# EAGLE design Electret Mic Preamp v1.1 (EAGLE 7.6.0)
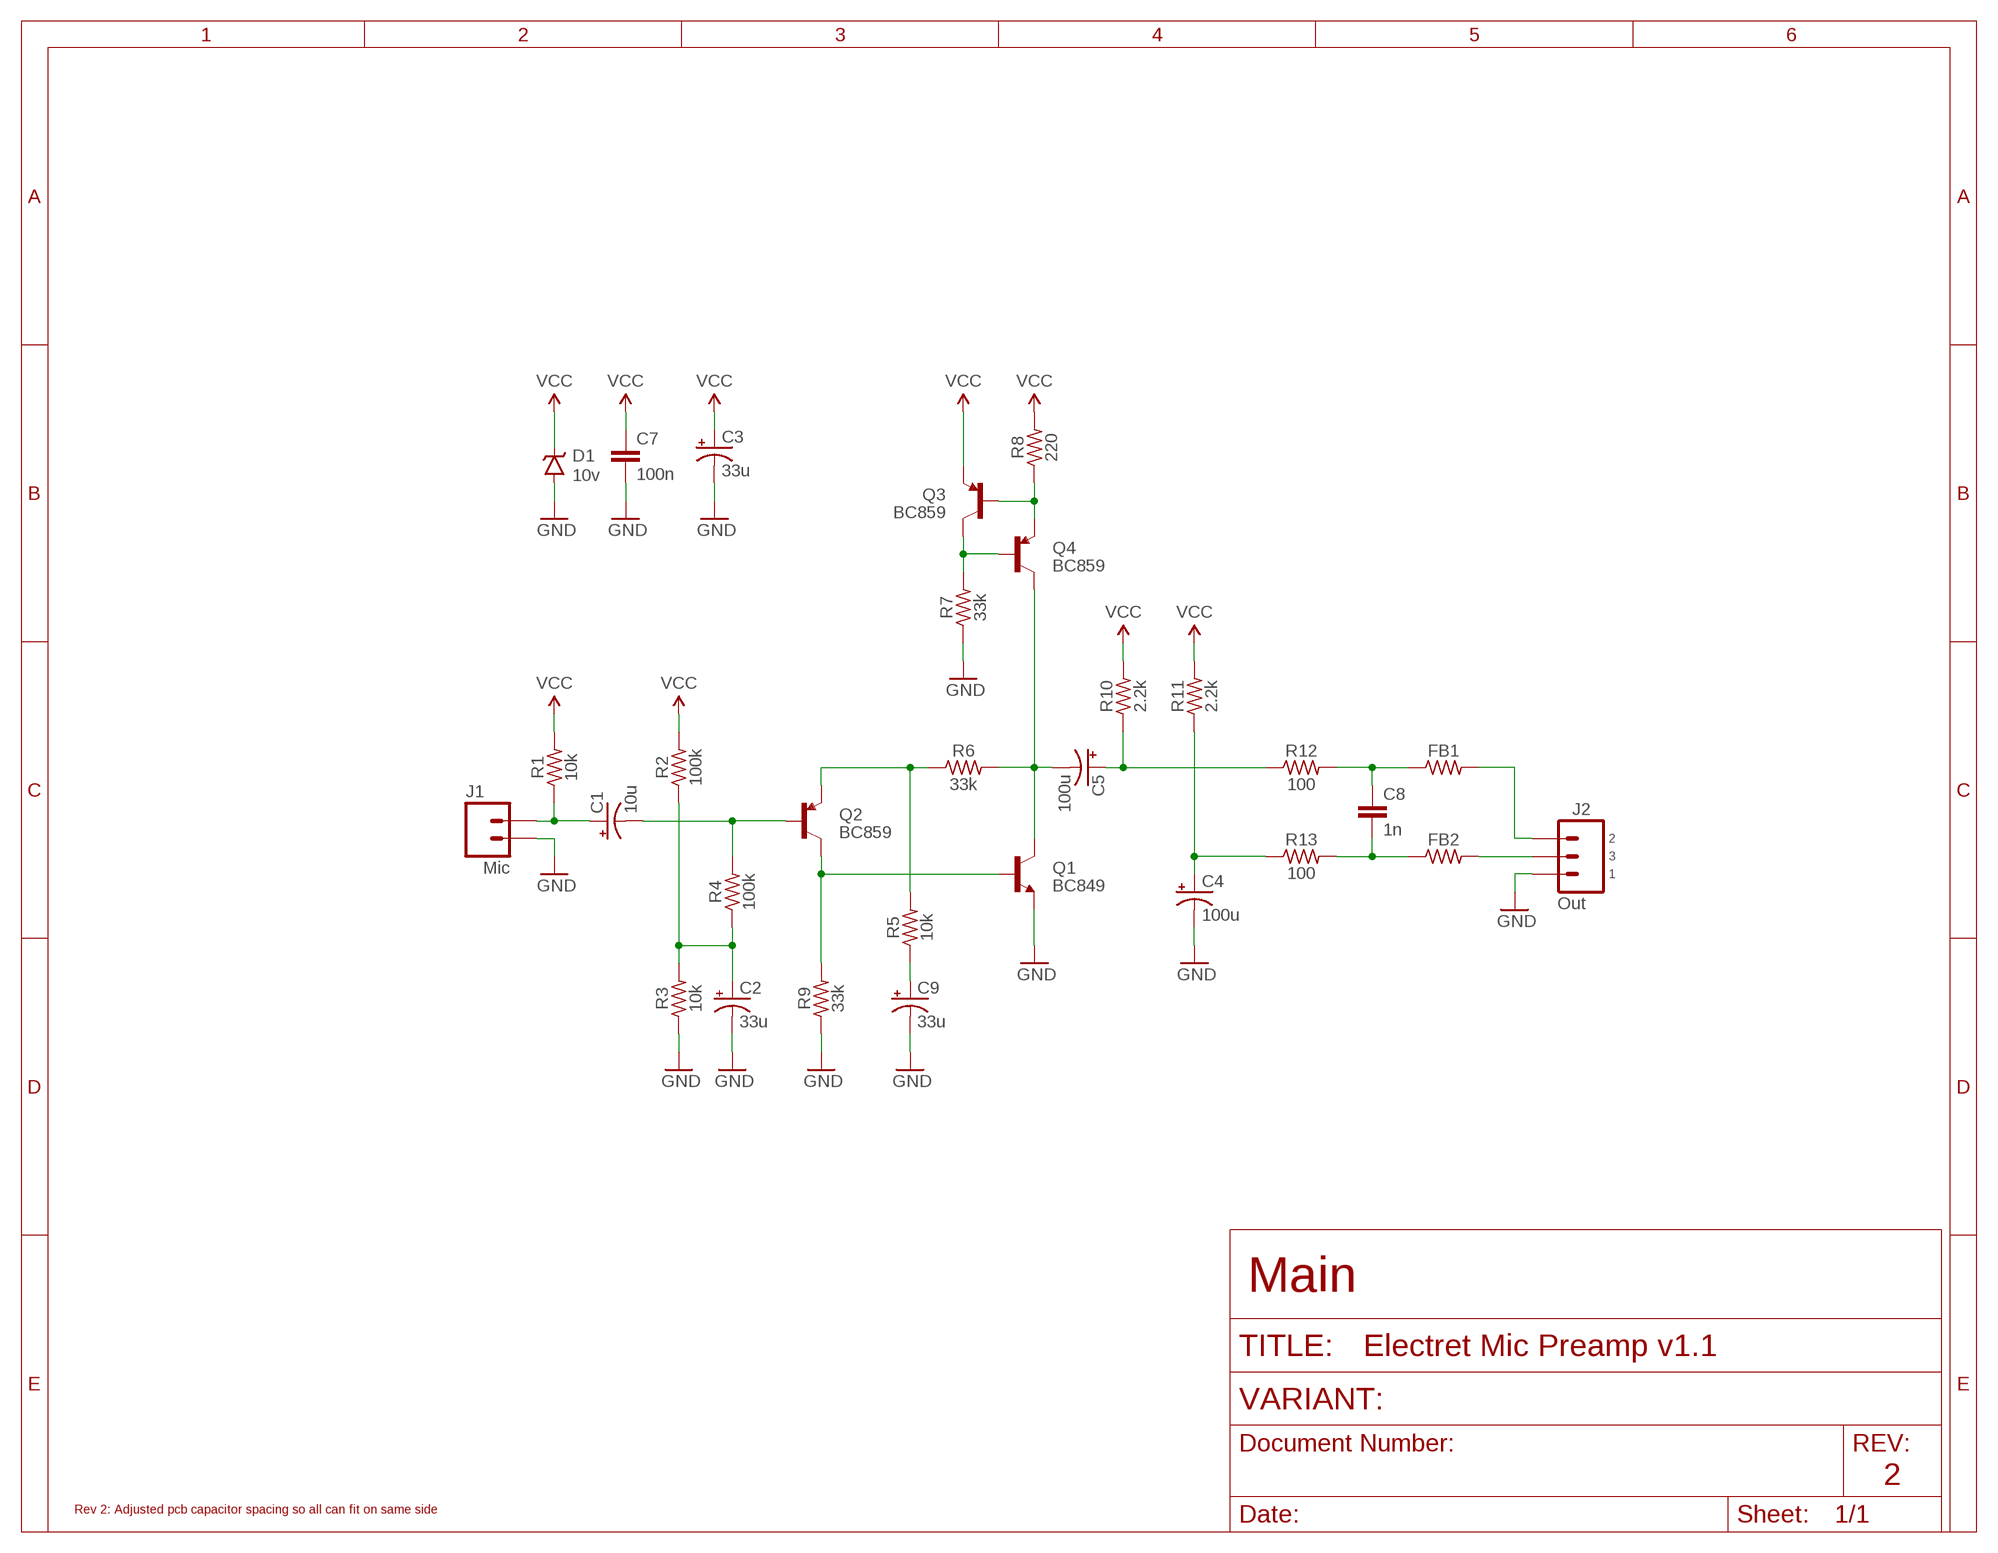
[diagram p0: schematic, sheet 1]
FRAME1 (FRAME_A_L): DESCRIPTION: Main; REV: 2

## Parts
C1  10u  CPOL-USE1.8-4  [E1,8-4]
C2  33u  CPOL-USE2.5-6  [E2,5-6]
C3  33u  CPOL-USE2.5-6  [E2,5-6]
C4  100u  CPOL-USE2.5-6  [E2,5-6]
C5  100u  CPOL-USE2.5-6  [E2,5-6]
C7  100n  C-EUC0603  [C0603]
C8  1n  C-EUC0603  [C0603]
C9  33u  CPOL-USE2.5-6  [E2,5-6]
D1  10v  DIODE-ZENER16V  [SOD-123]
FB1  RESISTORR0603  [R0603]
FB2  RESISTORR0603  [R0603]
J1  Mic  M02PTH  [1X02]
J2  Out  M03PTH  [1X03]
Q1  BC849  TRANSISTOR-NPNSOT23-3  [SOT23-3]
Q2  BC859  TRANSISTOR-PNPSOT23-3  [SOT23-3]
Q3  BC859  TRANSISTOR-PNPSOT23-3  [SOT23-3]
Q4  BC859  TRANSISTOR-PNPSOT23-3  [SOT23-3]
R1  10k  RESISTORR0603  [R0603]
R2  100k  RESISTORR0603  [R0603]
R3  10k  RESISTORR0603  [R0603]
R4  100k  RESISTORR0603  [R0603]
R5  10k  RESISTORR0603  [R0603]
R6  33k  RESISTORR0603  [R0603]
R7  33k  RESISTORR0603  [R0603]
R8  220  RESISTORR0603  [R0603]
R9  33k  RESISTORR0603  [R0603]
R10  2.2k  RESISTORR0603  [R0603]
R11  2.2k  RESISTORR0603  [R0603]
R12  100  RESISTORR0603  [R0603]
R13  100  RESISTORR0603  [R0603]

## Nets
GND: C2.- C3.- C4.- C7.2 C9.- D1.A J1.2 J2.3 Q1.2(E) R3.1 R7.1 R9.1
N$1: C1.+ J1.1 R1.1
N$2: Q3.3(C) Q4.1(B) R7.2
N$3: C2.+ R2.1 R3.2 R4.1
N$4: C1.- Q2.1(B) R4.2
N$5: Q2.2(E) R5.2 R6.1
N$6: Q1.1(B) Q2.3(C) R9.2
N$7: C9.+ R5.1
N$8: Q3.1(B) Q4.2(E) R8.1
N$9: C5.- Q1.3(C) Q4.3(C) R6.2
N$10: C5.+ R10.1 R12.1
N$11: C4.+ R11.1 R13.1
N$12: C8.1 FB1.1 R12.2
N$13: C8.2 FB2.1 R13.2
N$14: FB2.2 J2.2
N$15: FB1.2 J2.1
VCC: C3.+ C7.1 D1.C Q3.2(E) R1.2 R2.2 R8.2 R10.2 R11.2

## Notes on the sheet
- Rev 2: Adjusted pcb capacitor spacing so all can fit on same side

## Library data of the parts
C1-C5 C9 = Skoba:CPOL-US: POLARIZED CAPACITOR, American symbol
C7 C8 = Skoba:C-EU: CAPACITOR, European symbol
D1 = Skoba:DIODE-ZENER: Zener Diode; PROD_ID: DIO-12440; VALUE: 16V
FB1 FB2 R1-R13 = Skoba:RESISTOR: RESISTOR, American symbol
J1 = Skoba:M02: Standard 2-pin 0.1" header. Use with; VALSTAT: LABEL
J2 = Skoba:M03: Header 3 Standard 3-pin 0.1" header. Use with straight break away headers (SKU : PRT-00116), right angle break away headers (PRT-00553), swiss pins (PRT-00743), machine pins (PRT-00117), and female headers (PRT-00115). Molex polarized connector foot print use with SKU : PRT-08232 with associated ...; PIN1: 2; PIN2: 3; PIN3: 1; VALSTAT: LABEL
Q1 = Skoba:TRANSISTOR-NPN
Q2-Q4 = Skoba:TRANSISTOR-PNP

## Board
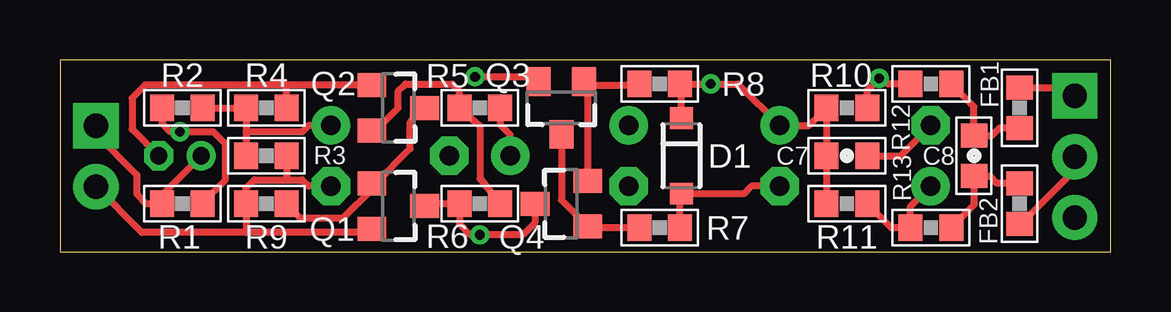
[diagram p1: board, top side]
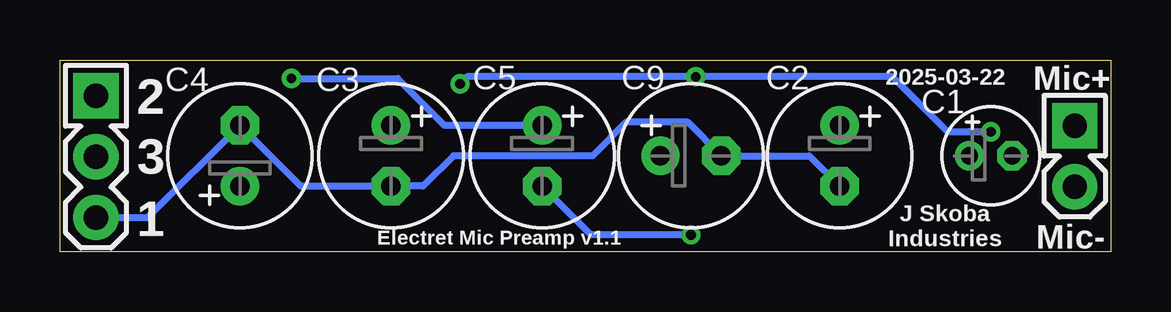
[diagram p2: board, bottom side, seen from below]

Size 43.8 x 8 mm. Coordinates in mm from the lower left corner, seen from the top.
Outline: 0,0 43.8,0 43.8,8 0,8 0,0
Copper layers (1*16): Top 0.035mm / dielectric 1.5mm / Bottom 0.035mm
Design rules "dirt_cheap_dirty_boards.v1": minimum track width 5mil, minimum drill 12mil, track to track 5mil, track to pad 5mil, pad to pad 5mil, via to via 5mil, smd to smd 0mil, copper to edge 10mil, drill to drill 10mil, minimum pad ring 10mil, minimum via ring 8mil, stop-mask expansion 2mil, vias tented up to drill 25mil, thermal gap 10mil

### Footprints (pad centres in the part's own frame; a part is rotated, then mirrored left to right if it is on the bottom)
E1,8-4 = drill 0.711 pad 1.168: + -0.889,0 | drill 0.711 pad 1.168 octagon: - 0.889,0
E2,5-6 = drill 0.813 pad 1.6: + -1.27,0 | drill 0.813 pad 1.6 octagon: - 1.27,0
C0603 = smd 1 x 1.1: 1 -0.85,0; 2 0.85,0
SOD-123 = smd 0.9 x 0.95: A 1.575,0; C -1.575,0
R0603 = smd 1 x 1.1: 1 -0.85,0; 2 0.85,0
1X02 = drill 1.016 pad 1.88 square: 1 0,0 | drill 1.016 pad 1.88: 2 2.54,0
1X03 = drill 1.016 pad 1.88 square: 1 0,0 | drill 1.016 pad 1.88: 2 2.54,0; 3 5.08,0
SOT23-3 = smd 1 x 1.2: 1 -0.95,-1.1; 2 0.95,-1.1; 3 0,1.1

### Placement (x,y rotation side)
C1  5,4 0 bottom
C2  11.3,4 270 bottom
C3  30,4 270 bottom
C4  36.3,4 90 bottom
C5  23.7,4 270 bottom
C7  32.8,4 0 top
C8  38.1,4 270 top
C9  17.5,4 0 bottom
D1  25.9,4 270 top
FB1  40,6 90 top
FB2  40,2 270 top
J1  1.5,5.25 270 bottom
J2  42.3,6.5 270 bottom
Q1  14.1,1.9 270 top
Q2  14.1,6 270 top
Q3  20.9,6 180 top
Q4  20.9,2 90 top
R1  5.1,2 0 top
R2  5.1,6 180 top
R3  8.6,4 180 top
R4  8.6,6 0 top
R5  17.5,6 180 top
R6  17.5,2 180 top
R7  25,1 180 top
R8  25,7 0 top
R9  8.6,2 0 top
R10  32.8,6 180 top
R11  32.8,2 180 top
R12  36.3,7 0 top
R13  36.3,1 0 top

### Tracks (layer width: path | path; a pad name or v marks a point on that pad's centre or on a via)
GND
  Top 0.3: 9.45,3 8.1,3 7.75,2.65 R9.1 7.75,0.8 | 9.45,3 10.1,3 10.37,2.73 C2.- | R3.1 9.45,3 | Q1.2 12.95,0.95 12.8,0.8 7.75,0.8 | R7.1 25.85,2.38 D1.A 28.52,2.42 28.83,2.73 C3.- | C7.2 35.03,4 C4.- | 7.75,0.8 3.41,0.8 J1.2
  Bottom 0.3: C2.- 12.57,4 C9.- 17.63,5.4 20.2,5.4 21.6,4 27.4,4 28.67,2.73 C3.- 33.76,2.73 C4.- 40.15,1.42 J2.3
N$1
  Top 0.3: R1.1 4.1,2 | R1.1 3.6,2 3.2,2.4 3.2,3.2 1.5,4.9 J1.1 | R1.1 4.25,2.36 C1.+
N$2
  Top 0.3: R7.2 22.05,1 Q4.1 20.9,2.15 Q3.3
N$3
  Top 0.3: R2.1 R4.1 7.75,5 | 7.75,5 R3.2 | C2.+ 10.37,5.27 10.1,5 7.75,5
N$4
  Top 0.3: Q2.1 9.45,6.95 | 9.45,6.95 3.55,6.95 3,6.4 3,5.11 C1.- | R4.2 9.45,6.95
N$5
  Top 0.3: Q2.2 13.15,5.05 14.1,6 14.1,6.7 14.4,7 16.35,7 16.65,6.7 R5.2 | R5.2 16.75,5.85 | R6.1 17.5,3.05 17.5,5.25 R5.2
N$6
  Top 0.3: R9.2 9.45,1.95 10,1.4 11.8,1.4 13,2.6 Q1.1 13.15,2.85 14.6,4.3 14.6,5.4 Q2.3
N$7
  Top 0.3: C9.+ 18.77,4.88 18.35,5.3 R5.1
N$8
  Top 0.3: Q4.2 22,6.95 | 22,6.95 Q3.1 | 22,6.95 23.6,6.95 R8.1
N$9  (via drill 0.4)
  Top 0.3: Q1.3 15.3,2 R6.2 16.65,1.15 17.1,0.7 v17.5,0.7 19.3,0.7 19.8,1.2 Q4.3
  Bottom 0.3: C5.- 21.67,0.7 v17.5,0.7
N$10  (via drill 0.4)
  Top 0.3: R12.1 34.5,7 34.28,7.22 v34.15,7.22 33.65,6.72 R10.1
  Bottom 0.3: C5.+ 27.77,5.27 29.72,7.22 v34.15,7.22
N$11
  Top 0.3: R11.1 34.65,1 R13.1 35.45,1.88 C4.+
N$12
  Top 0.3: C8.1 38.1,6.05 R12.2 | 38.4,5.15 C8.1 | FB1.1 39.15,5.15 38.85,4.85 C8.1
N$13
  Top 0.3: R13.2 38.1,1.95 C8.2 38.75,3.15 39.05,2.85 FB2.1
N$14
  Top 0.3: FB2.2 40.05,1.15 42.3,3.4 J2.2
N$15
  Top 0.3: FB1.2 41.95,6.85 J2.1
VCC  (via drill 0.4)
  Top 0.3: R11.2 C7.1 R10.2 31.22,5.27 C3.+ 28.27,7 v27.12,7 R8.2 25.9,6.95 D1.C | 4.25,5.85 R2.2 4.25,5.35 4.6,5 v5,5 6.4,5 6.9,4.5 6.9,3 5.95,2.05 R1.2 | 19.95,7.3 Q3.2 19.75,7.3 v17.3,7.3
  Bottom 0.3: v27.12,7 26.82,7.3 v17.3,7.3 9.1,7.3 6.8,5 v5,5

### Text on the board
bPlace: 2025-03-22 | Mic+ | 2 | 3 | J Skoba / Industries | Electret Mic Preamp v1.1 | 1 | Mic-